# Altium project Projet_Finale.PrjPcb
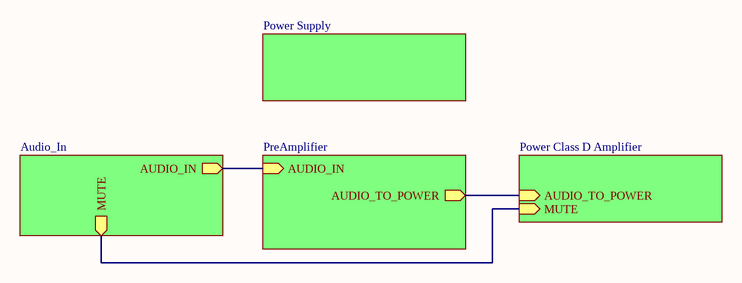
[diagram p0: TopLevel.SchDoc]
5 sheets, 76 parts. Net scope: hierarchical (ports join the sheet entries above them; power ports are global).
Board file: ProjetFinale.PcbDoc
Sheets:
  TopLevel.SchDoc
    PreAmplifier = PreAmli.SchDoc
    Audio_In = Audi_In.SchDoc
    Power Class D Amplifier = PowerStage.SchDoc
    Power Supply = PowerSupply.SchDoc

## Sheet TopLevel.SchDoc
size A4; SheetNumber: 1; SheetTotal: 5

### Sub-sheets
Audio_In = Audi_In.SchDoc: MUTE (out), AUDIO_IN (out)
Power Class D Amplifier = PowerStage.SchDoc: MUTE (in), AUDIO_TO_POWER (in)
Power Supply = PowerSupply.SchDoc: no entries
PreAmplifier = PreAmli.SchDoc: AUDIO_IN (in), AUDIO_TO_POWER (out)

### Nets
OUT_5V: sheet PreAmplifier/AUDIO_TO_POWER, sheet Power Class D Amplifier/AUDIO_TO_POWER
NetBT_Audio_2: sheet Audio_In/MUTE, sheet Power Class D Amplifier/MUTE
NetC15_1: sheet PreAmplifier/AUDIO_IN, sheet Audio_In/AUDIO_IN

## Sheet PreAmli.SchDoc
size A4; SheetNumber: 2; SheetTotal: 5
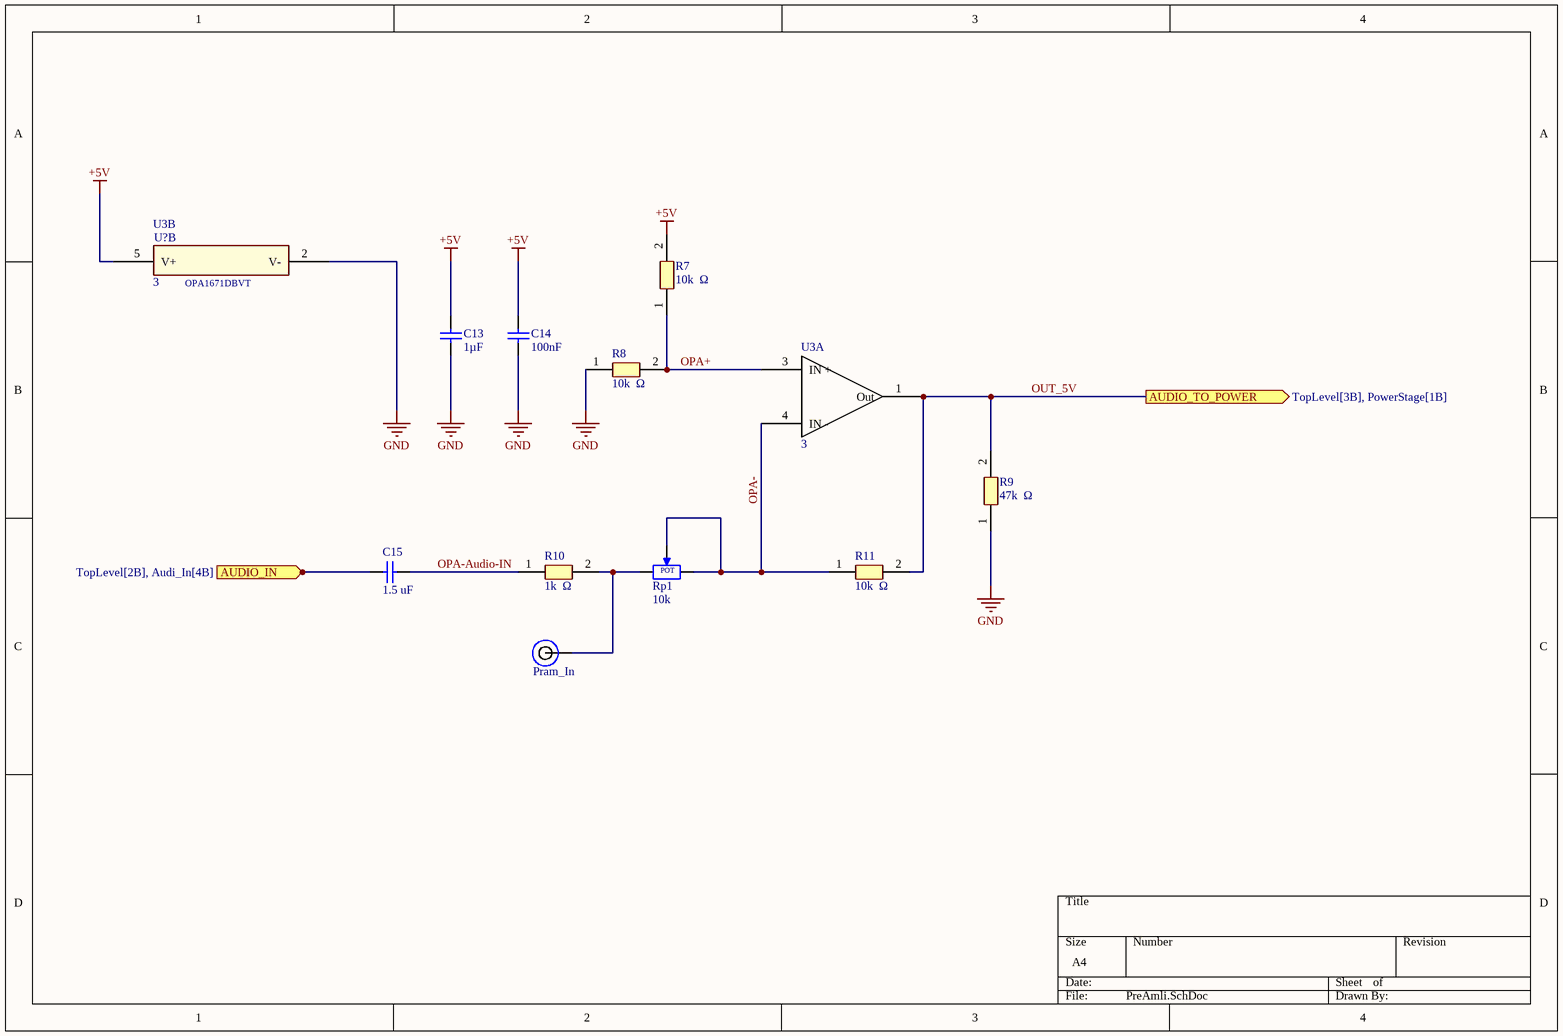
[diagram p1: PreAmli.SchDoc]

### Parts
C13  1µF  [CAPACITOR_1206]
C14  100nF  [CAPACITOR_1206]
C15  1.5 uF  [CAPACITOR_1206]
R7  10k  Ω  [RESISTOR_1206]
R8  10k  Ω  [RESISTOR_1206]
R9  47k  Ω  [RESISTOR_1206]
R10  1k  Ω  [RESISTOR_1206]
R11  10k  Ω  [RESISTOR_1206]
Rp1  10k  [3362P]
T1  Pram_In  [Test Point 1.32mm]
U3  3  [AOP-1671IDBVR]  (parts A,B of 2)

### Ports
AUDIO_IN (in, see TopLevel[2B], Audi_In[4B]), AUDIO_TO_POWER (out, see TopLevel[3B], PowerStage[1B])

### Nets
+5V: C13.2 C14.2 R7.2 U3.5(V+)
GND: C13.1 C14.1 R8.1 R9.1 U3.2(V-)
OPA+: R7.1 R8.2 U3.3(IN_+)
OPA-: R11.1 Rp1.2(cathode) Rp1.3(cathode) U3.4(IN_-)
OPA-Audio-IN: C15.2 R10.1
OUT_5V: R9.2 R11.2 U3.1(Out) ; port AUDIO_TO_POWER
NetC15_1: C15.1 ; port AUDIO_IN
NetR10_2: R10.2 Rp1.1(Anode) T1.1

### Notes on the sheet
- (in symbol OPA1671DBVT, part B) U?B
- (in symbol Potentiometer) POT

### Library data of the parts
C13 C15 = Capacitor: Rated Voltage: 100 V; Value: 100nF; Case-Metric: 3216; Case-EIA: 1206; Tolerance: Â±5%; Technology: SMT; Max Thickness: 1.7 mm
C14 = Capacitor: Rated Voltage: 100 V; Case-Metric: 3216; Case-EIA: 1206; Tolerance: Â±5%; Technology: SMT; Value: 100nF; Max Thickness: 1.7 mm
R7-R11 = Resistor: Résistance
Rp1 = Potentiometer: Manufacturer: *; Manufacturer Part Number: *; Supplier: *; Supplier Part Number: *; Supplier Unit Price: *; MOQ: *
T1 = Test Point: PCB Test Point, Type 8 Series, Black, Through Hole Mount, 1.32 mm, Phosphor Bronze; Manufacturer: VERO; Manufacturer Part Number: 20-2136; Supplier Part Number: 8731195; Supplier: Farnell; Supplier Unit Price: 0.132; MOQ: 100
U3 = OPA1671DBVT: AOP

## Sheet Audi_In.SchDoc
size A4; CompanyName: HEPL; Engineer: CBR; Address1: Quai Gloesener 6; Address2: 4020, liege; SheetNumber: 3; SheetTotal: 5; Version: 1.0
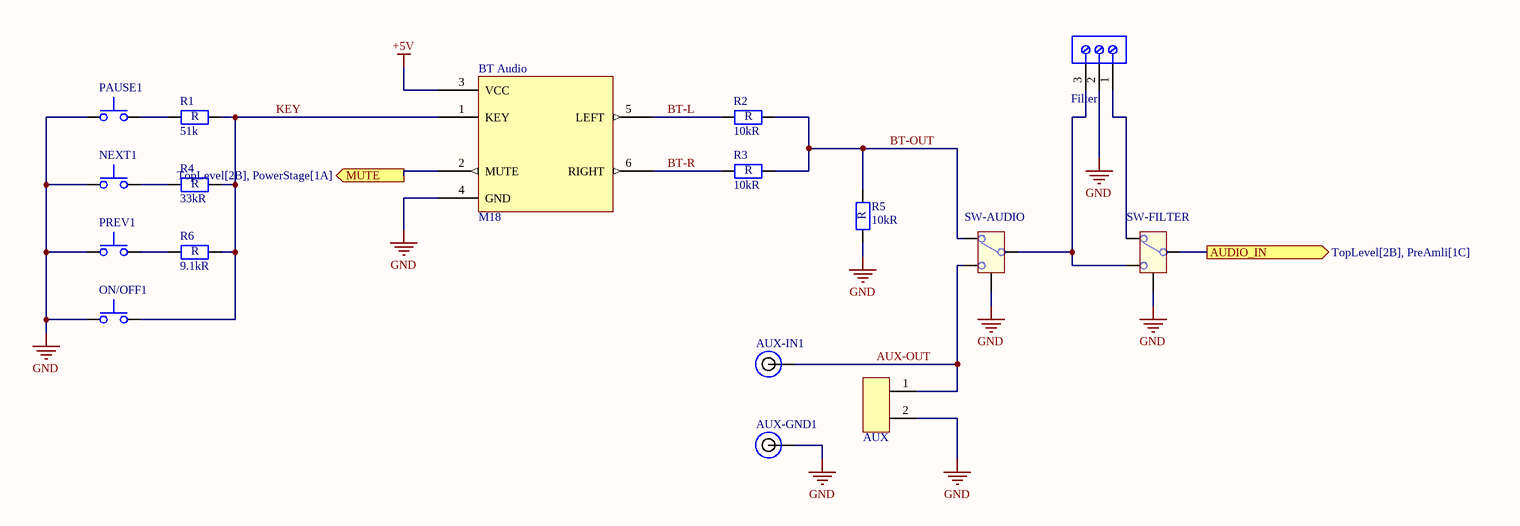
[diagram p2: Audi_In.SchDoc]

### Parts
AUX  (no value)  [TS-75x70]
AUX-GND1  (no value)  [Test Point 1.32mm]
AUX-IN1  (no value)  [Test Point 1.32mm]
BT_Audio  M18  [Bluetooth-M18 flat]
Filter  val?  [691214110003]  (value not drawn)
NEXT1  (no value)  [TackS-35X60]
ON/OFF1  (no value)  [TackS-35X60]
PAUSE1  (no value)  [TackS-35X60]
PREV1  (no value)  [TackS-35X60]
R1  51k  [1206-R]
R2  10kR  [1206-R]
R3  10kR  [1206-R]
R4  33kR  [1206-R]
R5  10kR  [1206-R]
R6  9.1kR  [1206-R]
SW-AUDIO  (no value)  [SPDT-OS102011MS2QN1]
SW-FILTER  (no value)  [SPDT-OS102011MS2QN1]

### Ports
AUDIO_IN (out, see TopLevel[2B], PreAmli[1C]), MUTE (out, see TopLevel[2B], PowerStage[1A])

### Nets
+5V: BT_Audio.3(VCC)
GND: AUX.2 AUX-GND1.1 BT_Audio.4(GND) Filter.2 NEXT1.1 ON/OFF1.1 PAUSE1.1 PREV1.1 R5.1 SW-AUDIO.4(shield) SW-FILTER.4(shield)
AUX-OUT: AUX.1 AUX-IN1.1 SW-AUDIO.3(NO)
BT-L: BT_Audio.5(LEFT) R2.1
BT-OUT: R2.2 R3.2 R5.2 SW-AUDIO.1(NC)
BT-R: BT_Audio.6(RIGHT) R3.1
KEY: BT_Audio.1(KEY) ON/OFF1.2 R1.2 R4.2 R6.2
NetBT_Audio_2: BT_Audio.2(MUTE) ; port MUTE
NetC15_1: SW-FILTER.2(C) ; port AUDIO_IN
NetFilter_1: Filter.1 SW-FILTER.1(NC)
NetFilter_3: Filter.3 SW-AUDIO.2(C) SW-FILTER.3(NO)
NetNEXT1_2: NEXT1.2 R4.1
NetPAUSE1_2: PAUSE1.2 R1.1
NetPREV1_2: PREV1.2 R6.1

### Notes on the sheet
- Title :
- HEPL
- Size :
- Date :
- A4
- sheet name :
- Time :
- Sheet
- of
- Engineer :
- Quai Gloesener
- 4020 Liège
- Version :
- (in symbol Resistor) R

### Library data of the parts
AUX = Connector-2: Fixed Terminal Blocks PT 1.5/2-3.5H 2POS HRZ 3.5mm SCREW; Manufacturer: Phoenix Contact; Manufacturer Part Number: 1984617; Supplier: Mouser; Supplier Part Number: 651-1984617; Supplier Unit Price: 0.55; MOQ: 1
AUX-GND1 AUX-IN1 = Test Point: as T1 on sheet PreAmli; Supplier Part Number: 8731195; Supplier: Farnell; Supplier Unit Price: 0.132; MOQ: 100
BT_Audio = M18-Bluetooth: BLUETOOTH AUDIO TRANSFER MODULE; Manufacturer: *; Manufacturer Part Number: *; Supplier: *; Supplier Part Number: *; Supplier Unit Price: *; MOQ: *
Filter = Screw Terminal 3x: Manufacturer: WE; Manufacturer Part Number: 691-214110-003; Supplier: mouser; Supplier Part Number: 710-691214110003; Supplier Unit Price: 1.16; MOQ: 1
NEXT1 ON/OFF1 PAUSE1 PREV1 = TackSwitch Simple: Manufacturer: MULTICOMP PRO; Manufacturer Part Number: DTSM-32S-B; Supplier Part Number: 9471898; Supplier: Farnell; Supplier Unit Price: 0.188; MOQ: 10
R1-R6 = Resistor: Manufacturer: *; Manufacturer Part Number: *; Supplier: *; Supplier Part Number: *; Supplier Unit Price: *; MOQ: *
SW-AUDIO SW-FILTER = SPDT: Slide Switches SPDT On-On; Manufacturer: C&K; Manufacturer Part Number: OS102011MS2QN1; Supplier: Mouser; Supplier Part Number: 611-OS102011MS2QN1; Supplier Unit Price: 0.39; MOQ: 1

## Sheet PowerStage.SchDoc
size A4; CompanyName: HEPL; Engineer: CBR; Address1: Quai Gloesener 6; Address2: 4020, liege; SheetNumber: 4; SheetTotal: 5; Version: 1.0
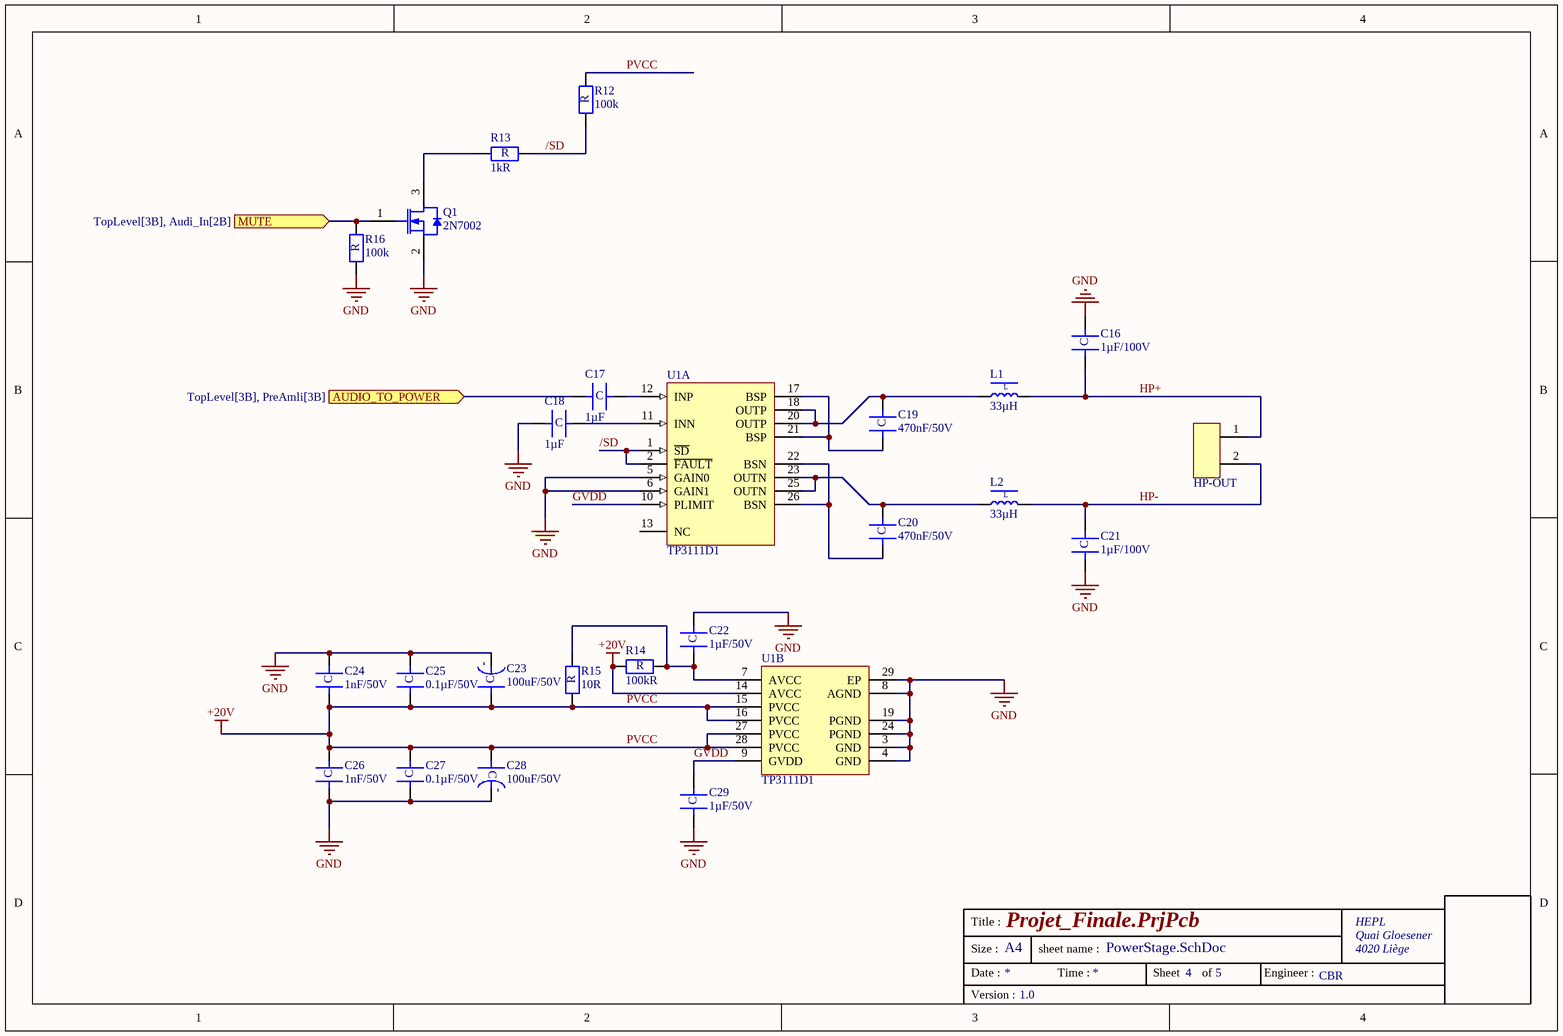
[diagram p3: PowerStage.SchDoc]

### Parts
C16  1µF/100V  [C180x75]
C17  1µF  [1206-C]
C18  1µF  [1206-C]
C19  470nF/50V  [1206-C]
C20  470nF/50V  [1206-C]
C21  1µF/100V  [C180x75]
C22  1µF/50V  [1206-C]
C23  100uF/50V  [C100x160]
C24  1nF/50V  [1206-C]
C25  0.1µF/50V  [1206-C]
C26  1nF/50V  [1206-C]
C27  0.1µF/50V  [1206-C]
C28  100uF/50V  [C100x160]
C29  1µF/50V  [1206-C]
HP-OUT  (no value)  [TS-75x70]
L1  33µH  [SRR1260]
L2  33µH  [SRR1260]
Q1  2N7002  [INF-PG-SOT23_M]
R12  100k  [1206-R]
R13  1kR  [1206-R]
R14  100kR  [1206-R]
R15  10R  [1206-R]
R16  100k  [1206-R]
U1  TP3111D1  [TI-PWP28-5720X1950TP_M]  (parts A,B of 2)

### Ports
AUDIO_TO_POWER (in, see TopLevel[3B], PreAmli[3B]), MUTE (in, see TopLevel[3B], Audi_In[2B])

### Nets
GND: C16.2 C18.1 C21.1 C22.2 C23.2 C24.2 C25.2 C26.1 C27.1 C28.2 C29.1 Q1.2(SOURCE) R16.1 U1.3(GND) U1.4(GND) U1.5(GAIN0) U1.6(GAIN1) U1.8(AGND) U1.19(PGND) U1.24(PGND) U1.29(EP)
PVCC: C23.1 C24.1 C25.1 C26.2 C27.2 C28.1 R12.2 R14.1 R15.1 U1.14(AVCC) U1.15(PVCC) U1.16(PVCC) U1.27(PVCC) U1.28(PVCC)  [also labelled +20V]
/SD: R12.1 R13.2 U1.1(~{SD}) U1.2(~{FAULT})
GVDD: C29.2 U1.9(GVDD) U1.10(PLIMIT)
HP+: C16.1 HP-OUT.1 L1.2(cathode)
HP-: C21.2 HP-OUT.2 L2.2(cathode)
OUT_5V: C17.1 ; port AUDIO_TO_POWER
NetBT_Audio_2: Q1.1(GATE) R16.2 ; port MUTE
NetC17_2: C17.2 U1.12(INP)
NetC18_2: C18.2 U1.11(INN)
NetC19_1: C19.1 U1.17(BSP) U1.21(BSP)
NetC19_2: C19.2 L1.1(Anode) U1.18(OUTP) U1.20(OUTP)
NetC20_1: C20.1 U1.22(BSN) U1.26(BSN)
NetC20_2: C20.2 L2.1(Anode) U1.23(OUTN) U1.25(OUTN)
NetC22_1: C22.1 R14.2 R15.2 U1.7(AVCC)
NetQ1_3: Q1.3(DRAIN) R13.1

Not connected (* = marked no-connect by the designer): U1 13(NC)

### Notes on the sheet
- Title :
- HEPL
- Size :
- Date :
- A4
- sheet name :
- Time :
- Sheet
- of
- Engineer :
- Quai Gloesener
- 4020 Liège
- Version :
- (in symbol Capacitor-NP) C
- (in symbol Capacitor-Pol) -; C
- (in symbol Inductor) L
- (in symbol Resistor) R

### Library data of the parts
C16 C21 = Capacitor-NP: Film Capacitor; Manufacturer: KEMET; Manufacturer Part Number: SMR15105J100B06L16.5CBULK; Supplier: Mouser; Supplier Part Number: 80-SMR15105J100B0616; Supplier Unit Price: 4.3; MOQ: 1
C17-C20 C22 C24-C27 C29 = Capacitor-NP: Manufacturer: *; Manufacturer Part Number: *; Supplier: *; Supplier Part Number: *; Supplier Unit Price: *; MOQ: *
C23 C28 = Capacitor-Pol: Manufacturer: *; Manufacturer Part Number: *; Supplier: *; Supplier Part Number: *; Supplier Unit Price: *; MOQ: *
HP-OUT = Connector-2: as AUX on sheet Audi_In; Supplier: Mouser; Supplier Part Number: 651-1984617; Supplier Unit Price: 0.55; MOQ: 1
L1 L2 = Inductor: Fixed Inductors 33µH 20% SMD 1260; Manufacturer: Bourns; Manufacturer Part Number: SRR1260A-330M; Supplier: Mouser; Supplier Part Number: 652-SRR1260A-330M; Supplier Unit Price: 0.791; MOQ: 1
Q1 = 2N7002HW: N-Channel Mosfet 1.75 V VGSth; Manufacturer: Diotec; Manufacturer Part Number: 2N7002; Supplier: Mouser; Supplier Part Number: 637-2N7002; Supplier Unit Price: 0.27; MOQ: 1
R12-R16 = Resistor: Manufacturer: *; Manufacturer Part Number: *; Supplier: *; Supplier Part Number: *; Supplier Unit Price: *; MOQ: *
U1 = TPA3111D1: Manufacturer: TI; Manufacturer Part Number: TPA3111D1PWP; Supplier: Mouser; Supplier Part Number: 595-TPA3111D1PWP; Supplier Unit Price: 2.4; MOQ: 1

## Sheet PowerSupply.SchDoc
size A4; CompanyName: HEPL; Address1: Quai Gloesener 6; Address2: 4020, liege; SheetNumber: 5; SheetTotal: 5
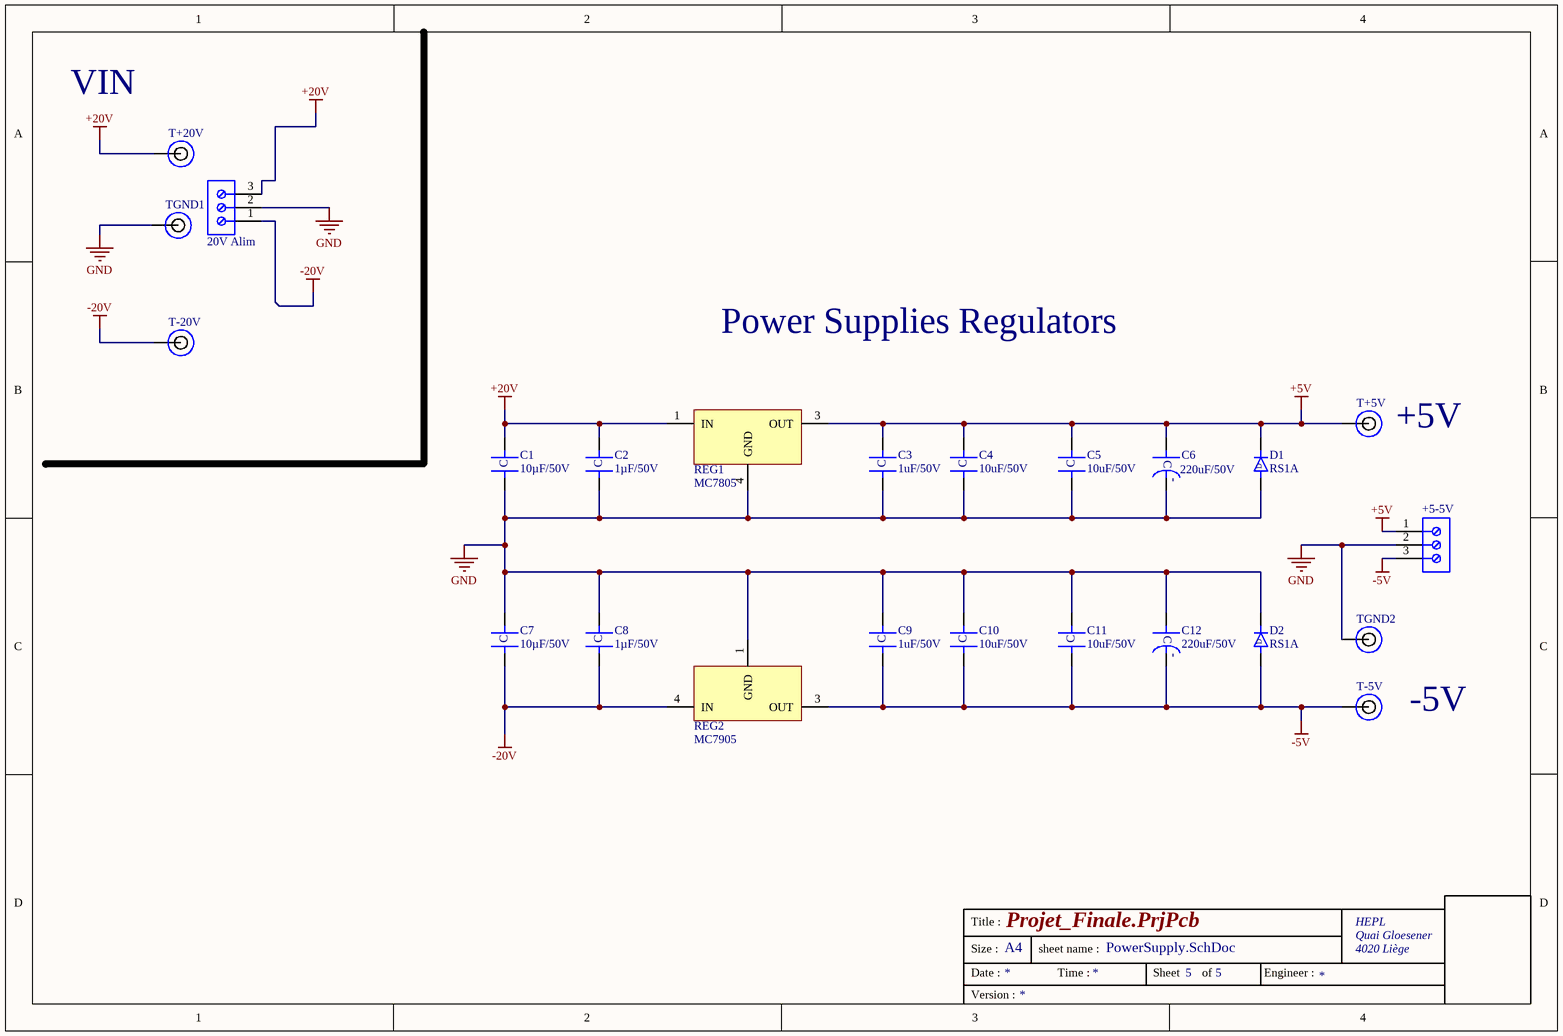
[diagram p4: PowerSupply.SchDoc]

### Parts
20V_Alim  val?  [691214110003]  (value not drawn)
+5-5V  val?  [691214110003]  (value not drawn)
C1  10µF/50V  [1206-C]
C2  1µF/50V  [1206-C]
C3  1uF/50V  [1206-C]
C4  10uF/50V  [1206-C]
C5  10uF/50V  [1206-C]
C6  220uF/50V  [C100x160]
C7  10µF/50V  [1206-C]
C8  1µF/50V  [1206-C]
C9  1uF/50V  [1206-C]
C10  10uF/50V  [1206-C]
C11  10uF/50V  [1206-C]
C12  220uF/50V  [C100x160]
D1  RS1A  [DO-214AC]
D2  RS1A  [DO-214AC]
REG1  MC7805  [D2PAK254P1420X457-3N]
REG2  MC7905  [D2PAK254P1420X457-3N]
T+5V  (no value)  [Test Point 1.32mm]
T+20V  (no value)  [Test Point 1.32mm]
T-5V  (no value)  [Test Point 1.32mm]
T-20V  (no value)  [Test Point 1.32mm]
TGND1  (no value)  [Test Point 1.32mm]
TGND2  (no value)  [Test Point 1.32mm]

### Nets
+5V: +5-5V.1 C3.2 C4.2 C5.2 C6.1 D1.2(cathode) REG1.3(OUT) T+5V.1
+20V: 20V_Alim.3 C1.2 C2.2 REG1.1(IN) T+20V.1  [project net PVCC]
-5V: +5-5V.3 C9.1 C10.1 C11.1 C12.2 D2.1(Anode) REG2.3(OUT) T-5V.1
-20V: 20V_Alim.1 C7.1 C8.1 REG2.4(IN) T-20V.1
GND: 20V_Alim.2 +5-5V.2 C1.1 C2.1 C3.1 C4.1 C5.1 C6.2 C7.2 C8.2 C9.2 C10.2 C11.2 C12.1 D1.1(Anode) D2.2(cathode) REG1.4(GND) REG2.1(GND) TGND1.1 TGND2.1

### Notes on the sheet
- VIN
- Power Supplies Regulators
- (near T+5V) +5V
- -5V
- Title :
- HEPL
- Size :
- Date :
- A4
- sheet name :
- Time :
- Sheet
- of
- Engineer :
- Quai Gloesener
- 4020 Liège
- Version :
- (in symbol Capacitor-NP) C
- (in symbol Capacitor-Pol) C; -
- (in symbol Diode) D

### Library data of the parts
20V_Alim +5-5V = Screw Terminal 3x: as Filter on sheet Audi_In; Supplier: mouser; Supplier Part Number: 710-691214110003; Supplier Unit Price: 1.16; MOQ: 1
C1-C5 C7-C11 = Capacitor-NP: Manufacturer: *; Manufacturer Part Number: *; Supplier: *; Supplier Part Number: *; Supplier Unit Price: *; MOQ: *
C6 C12 = Capacitor-Pol: Manufacturer: *; Manufacturer Part Number: *; Supplier: *; Supplier Part Number: *; Supplier Unit Price: *; MOQ: *
D1 D2 = Diode: Clamp Diode 1A 1.1 V / RS1A; Manufacturer: ONSEMI; Manufacturer Part Number: RS1A; Supplier: Mouser; Supplier Part Number: 512-RS1A; Supplier Unit Price: 0.372; MOQ: 1
REG1 = MC7800: Voltage Regulators –Positive-1.0 A - 5V; Manufacturer: onsemi; Manufacturer Part Number: MC7805BD2TR4G; Supplier: Mouser; Supplier Part Number: 863-MC7805BD2TR4G; Supplier Unit Price: 0.90; MOQ: 1
REG2 = MC7900: Voltage Regulators –Negative-1.0 A; Manufacturer: onsemi; Manufacturer Part Number: MC7905ACD2TR4G; Supplier: Mouser; Supplier Part Number: 863-MC7905ACD2TR4G; Supplier Unit Price: 0.809; MOQ: 1
T+5V T+20V T-5V T-20V TGND1 TGND2 = Test Point: as T1 on sheet PreAmli; Supplier Part Number: 8731195; Supplier: Farnell; Supplier Unit Price: 0.132; MOQ: 100

## Nets that join several sheets
+5V: PreAmli (C13.2 C14.2 R7.2 U3.5), Audi_In (BT_Audio.3), PowerSupply (8 pins)
GND: PreAmli (5 pins), Audi_In (11 pins), PowerStage (21 pins), PowerSupply (20 pins)
PVCC: PowerStage (14 pins), PowerSupply (5 pins)
NetBT_Audio_2: Audi_In (BT_Audio.2), PowerStage (Q1.1 R16.2)
NetC15_1: PreAmli (C15.1), Audi_In (SW-FILTER.2)
OUT_5V: PreAmli (R9.2 R11.2 U3.1), PowerStage (C17.1)